# Altium project HMI-MPG.PrjPcb
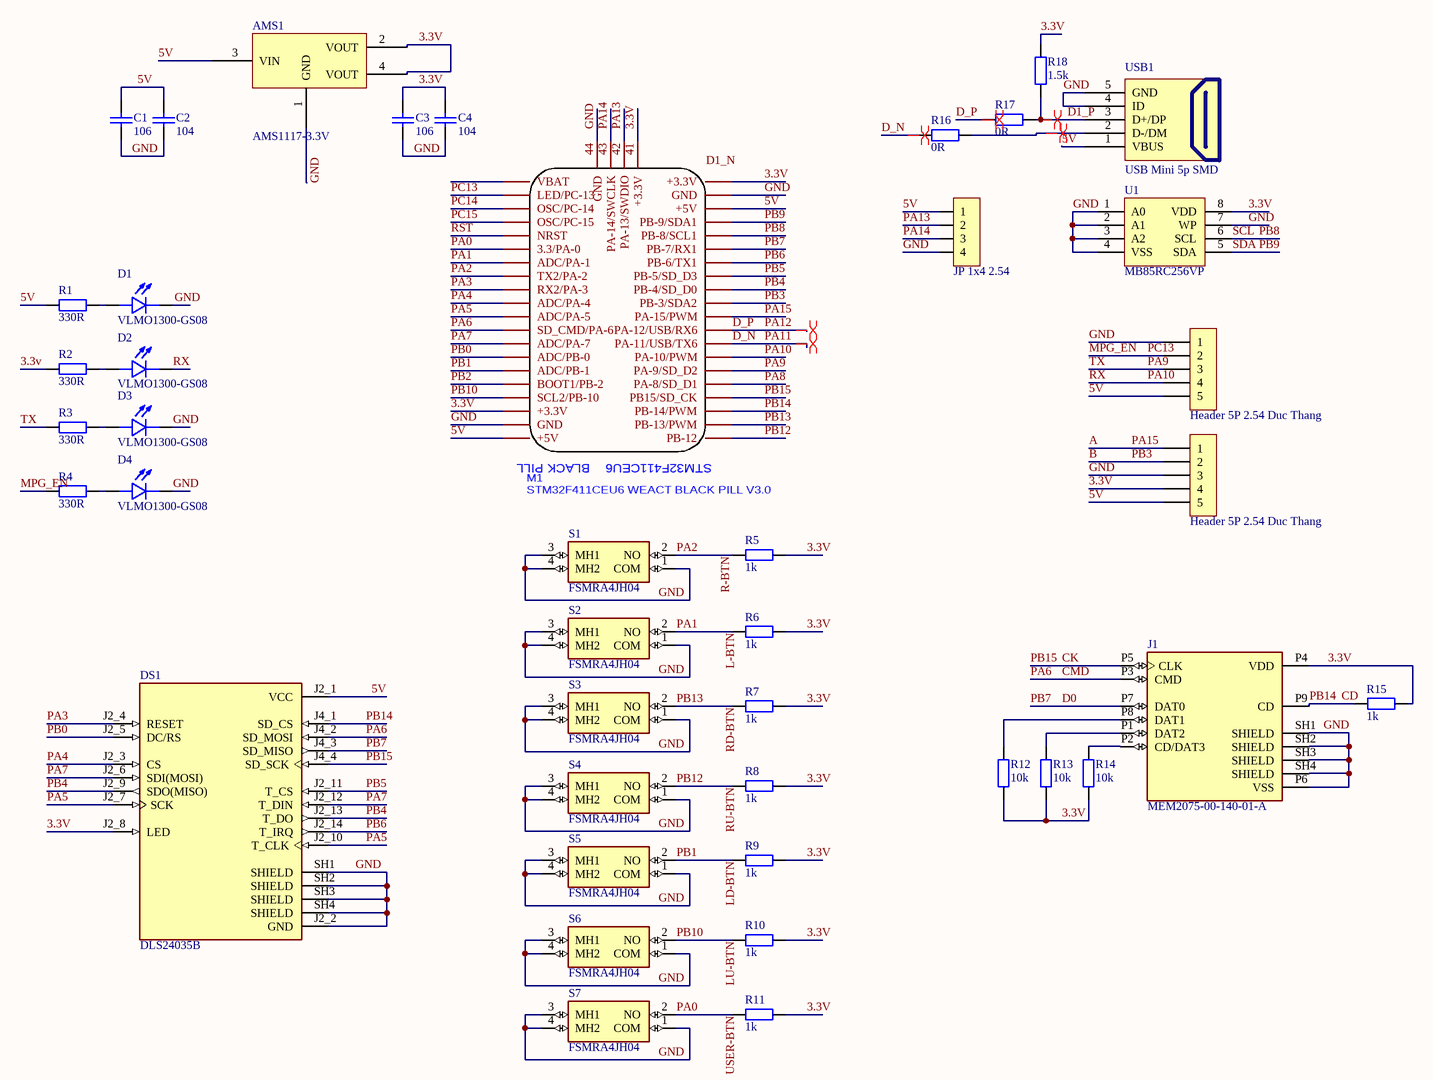
[diagram p0: Schematic.SchDoc]
1 sheet, 42 parts. Net scope: global (net labels, ports and power ports of the same name join across sheets).
Board file: PCB.PcbDoc

## Sheet Schematic.SchDoc
size A3; SheetNumber: 1; SheetTotal: 1

### Parts
AMS1  AMS1117-3.3V  [SOT223]
C1  106  [tu 0603]
C2  104  [tu 0603]
C3  106  [tu 0603]
C4  104  [tu 0603]
D1  VLMO1300-GS08  [LED_VLMO1300-GS08]
D2  VLMO1300-GS08  [LED_VLMO1300-GS08]
D3  VLMO1300-GS08  [LED_VLMO1300-GS08]
D4  VLMO1300-GS08  [LED_VLMO1300-GS08]
DS1  DLS24035B  [LCD_DLS24035B]
H1  Header 5P 2.54 Duc Thang  [XH2.54M-5]
H2  Header 5P 2.54 Duc Thang  [XH2.54M-5]
J1  MEM2075-00-140-01-A  [GCT_MEM2075-00-140-01-A]
JP1  JP 1x4 2.54  [JP 1x4 DT]
M1  STM32F411CEU6 WEACT BLACK PILL V3.0  [STM32F411CEU6BP]
R1  330R  [tro smd 0603]
R2  330R  [tro smd 0603]
R3  330R  [tro smd 0603]
R4  330R  [tro smd 0603]
R5  1k  [tro smd 0603]
R6  1k  [tro smd 0603]
R7  1k  [tro smd 0603]
R8  1k  [tro smd 0603]
R9  1k  [tro smd 0603]
R10  1k  [tro smd 0603]
R11  1k  [tro smd 0603]
R12  10k  [tro smd 0603]
R13  10k  [tro smd 0603]
R14  10k  [tro smd 0603]
R15  1k  [tro smd 0603]
R16  0R  [tro smd 0603]
R17  0R  [tro smd 0603]
R18  1.5k  [tro smd 0603]
S1  FSMRA4JH04  [FSMRA4JH04]
S2  FSMRA4JH04  [FSMRA4JH04]
S3  FSMRA4JH04  [FSMRA4JH04]
S4  FSMRA4JH04  [FSMRA4JH04]
S5  FSMRA4JH04  [FSMRA4JH04]
S6  FSMRA4JH04  [FSMRA4JH04]
S7  FSMRA4JH04  [FSMRA4JH04]
U1  MB85RC256VP  [SOIC8_50_328_25X90_SMT]
USB1  USB Mini 5p SMD  [USB Mini 5p SMD]

### Nets
3.3V: AMS1.2(VOUT) AMS1.4(VOUT) C3.1 C4.1 DS1.J2_8(LED) H2.4 J1.P4(VDD) M1.20(+3.3V) M1.38(+3.3V) M1.41(+3.3V) R2.1 R5.2 R6.2 R7.2 R8.2 R9.2 R10.2 R11.2 R12.1 R13.1 R14.1 R15.2 R18.2 U1.8(VDD)
5V: AMS1.3(VIN) C1.1 C2.1 DS1.J2_1(VCC) H1.5 H2.5 JP1.1 M1.18(+5V) M1.40(+5V) R1.1 USB1.1(VBUS)
A: H2.1 M1.10(PA-15/PWM)  [also labelled PA15]
B: H2.2 M1.11(PB-3/SDA2)  [also labelled PB3]
CD: DS1.J4_1(SD_CS) J1.P9(CD) M1.3(PB-14/PWM) R15.1  [also labelled PB14]
CK: DS1.J4_4(SD_SCK) J1.P5(CLK) M1.4(PB15/SD_CK)  [also labelled PB15]
CMD: DS1.J4_2(SD_MOSI) J1.P3(CMD) M1.32(SD_CMD/PA-6)  [also labelled PA6]
D0: DS1.J4_3(SD_MISO) J1.P7(DAT0) M1.15(PB-7/RX1)  [also labelled PB7]
D1_P: R17.2 R18.1 USB1.3(D+/DP)
D_N: M1.8(PA-11/USB/TX6) R16.1  [also labelled PA11]
D_P: M1.9(PA-12/USB/RX6) R17.1  [also labelled PA12]
GND: AMS1.1(GND) C1.2 C2.2 C3.2 C4.2 D1.C D3.C D4.C DS1.J2_2(GND) DS1.SH1(SHIELD) DS1.SH2(SHIELD) DS1.SH3(SHIELD) DS1.SH4(SHIELD) H1.1 H2.3 J1.P6(VSS) J1.SH1(SHIELD) J1.SH2(SHIELD) J1.SH3(SHIELD) J1.SH4(SHIELD) JP1.4 M1.19(GND) M1.39(GND) M1.44(GND) S1.1(COM) S1.3(MH1) S1.4(MH2) S2.1(COM) S2.3(MH1) S2.4(MH2) S3.1(COM) S3.3(MH1) S3.4(MH2) S4.1(COM) S4.3(MH1) S4.4(MH2) S5.1(COM) S5.3(MH1) S5.4(MH2) S6.1(COM) S6.3(MH1) S6.4(MH2) S7.1(COM) S7.3(MH1) S7.4(MH2) U1.1(A0) U1.2(A1) U1.3(A2) U1.4(VSS) U1.7(WP) USB1.4(ID) USB1.5(GND)
L-BTN: M1.27(ADC/PA-1) R6.1 S2.2(NO)  [also labelled PA1]
LD-BTN: M1.35(ADC/PB-1) R9.1 S5.2(NO)  [also labelled PB1]
LU-BTN: M1.37(SCL2/PB-10) R10.1 S6.2(NO)  [also labelled PB10]
MPG_EN: H1.2 M1.22(LED/PC-13) R4.1  [also labelled PC13]
PA0: M1.26(3.3/PA-0) R11.1 S7.2(NO)  [also labelled USER-BTN]
PA2: M1.28(TX2/PA-2) R5.1 S1.2(NO)  [also labelled R-BTN]
PA3: DS1.J2_4(RESET) M1.29(RX2/PA-3)
PA4: DS1.J2_3(CS) M1.30(ADC/PA-4)
PA5: DS1.J2_7(SCK) DS1.J2_10(T_CLK) M1.31(ADC/PA-5)
PA7: DS1.J2_6(SDI(MOSI)) DS1.J2_12(T_DIN) M1.33(ADC/PA-7)
PA8: M1.5(PA-8/SD_D1)
PA9: H1.3 M1.6(PA-9/SD_D2) R3.1  [also labelled TX]
PA10: D2.C H1.4 M1.7(PA-10/PWM)  [also labelled RX]
PA13: JP1.2 M1.42(PA-13/SWDIO)
PA14: JP1.3 M1.43(PA-14/SWCLK)
PB0: DS1.J2_5(DC/RS) M1.34(ADC/PB-0)
PB2: M1.36(BOOT1/PB-2)
PB4: DS1.J2_9(SDO(MISO)) DS1.J2_13(T_DO) M1.12(PB-4/SD_D0)
PB5: DS1.J2_11(T_CS) M1.13(PB-5/SD_D3)
PB6: DS1.J2_14(T_IRQ) M1.14(PB-6/TX1)
PB8: M1.16(PB-8/SCL1) U1.6(SCL)  [also labelled SCL]
PB9: M1.17(PB-9/SDA1) U1.5(SDA)  [also labelled SDA]
PB12: M1.1(PB-12) R8.1 S4.2(NO)  [also labelled RU-BTN]
PB13: M1.2(PB-13/PWM) R7.1 S3.2(NO)  [also labelled RD-BTN]
PC14: M1.23(OSC/PC-14)
PC15: M1.24(OSC/PC-15)
RST: M1.25(NRST)
NetD1_A: D1.A R1.2
NetD2_A: D2.A R2.2
NetD3_A: D3.A R3.2
NetD4_A: D4.A R4.2
NetJ1_P1: J1.P1(DAT2) R13.2
NetJ1_P2: J1.P2(CD/DAT3) R14.2
NetJ1_P8: J1.P8(DAT1) R12.2
NetR16_2: R16.2 USB1.2(D-/DM)

Not connected (* = marked no-connect by the designer): M1 21(VBAT)

### Layout directives
differential pair: D1_P, D_N, D_P, NetR16_2

### Notes on the sheet
- Labels drawn without touching a wire or pin: D1_N
- (in symbol STM32F411CEU6 WEACT BLACK PILL V3.0) BLACK PILL; STM32F411CEU6

### Library data of the parts
AMS1 = AMS1117 SMD: Dán; Value: AMS1117-3.3V SOT223; Don_Vi: Con; Ma_Hang: MH000596; Ghi_Chu: *; Kieu_Chan: *; Chung_Loai: Dán
C1 C3 = Tu 0603 106 16V 20%: Dán; Don_Vi: Con; So_Chan: 2; Ten_Linh_Kien: Tụ 0603-10uF 20% 16V; Ma_Hang: MH004848; Chung_Loai: Dán; Kieu_Chan: *
C2 C4 = Tu 0603 104 50V 10%: Dán; Don_Vi: Con; So_Chan: 2; Ten_Linh_Kien: Tụ 0603 104-100nF 10% 50V; Ma_Hang: MH004568; Chung_Loai: Dán; Kieu_Chan: *
D1-D4 = VLMO1300-GS08: Orange 605nm LED Indication - Discrete 2V 0603 (1608 Metric); MF: Vishay; SnapEDA_Link: https://www.snapeda.com/parts/VLMO1300-GS08/Vishay+Semiconductor+Opto+Division/view-part/?ref=snap; Package: 0603 Vishay; Value: *; MP: VLMO1300-GS08; Check_prices: https://www.snapeda.com/parts/VLMO1300-GS08/Vishay+Semiconductor+Opto+Division/view-part/?ref=eda
DS1 = DLS24035B: 3.5 Inch 480*320 SPI TFT LCD Module with ILI9488 Driver; MF: Elecrow; SnapEDA_Link: https://www.snapeda.com/parts/DLS24035B/Elecrow/view-part/?ref=snap; Package: None; Value: *; MP: DLS24035B; Check_prices: https://www.snapeda.com/parts/DLS24035B/Elecrow/view-part/?ref=eda
H1 H2 = Header 5P 2.54 Duc Thang: Cắm; Ten_Linh_Kien: Header 5P XH2.54-5P Đực Thẳng; Don_Vi: Con; Ma_Hang: MH001298; Chung_Loai: Cắm
J1 = MEM2075-00-140-01-A: 9 (8 + 1) Position Card Connector microSD Surface Mount, Right Angle Gold; MF: Global Connector Technology; SnapEDA_Link: https://www.snapeda.com/parts/MEM2075-00-140-01-A/Global+Connector+Technology/view-part/?ref=snap; Package: None; Value: *; MP: MEM2075-00-140-01-A; Check_prices: https://www.snapeda.com/parts/MEM2075-00-140-01-A/Global+Connector+Technology/view-part/?ref=eda
JP1 = JP 1x4 2.54 Duc Thang: Cắm; Ten_Linh_Kien: Jump Đơn Đực 2.54MM 1x40P Thẳng 11MM; Don_Vi: Con; Ma_Hang: MH000903; Ghi_Chu: *; Kieu_Chan: *; Chung_Loai: Cắm
R1-R4 = Tro 0603 5% 330R: Dán; Don_Vi: Con; Ma_Hang: MH006910; So_Chan: 2; Ten_Linh_Kien: Trở 0603 5% 330R; Chung_Loai: Dán; Kieu_Chan: *
R5-R11 R15 = Tro 0603 1% 1k: Dán; So_Chan: 2; Don_Vi: Con; Ten_Linh_Kien: Trở 0603 1% 1k; Ma_Hang: MH006334; Chung_Loai: Dán; Kieu_Chan: *
R12-R14 = Tro 0603 1% 10k: Dán; Don_Vi: Con; So_Chan: 2; Ten_Linh_Kien: Trở 0603 1% 10k; Ma_Hang: MH006333; Chung_Loai: Dán; Kieu_Chan: *
R16 R17 = Tro 0603 1% 0R: Dán; Don_Vi: Con; So_Chan: 2; Ten_Linh_Kien: Trở 0603 1% 0R; Ma_Hang: MH005792; Chung_Loai: Dán; Kieu_Chan: *
R18 = Tro 0603 5% 1.5k: Dán; Don_Vi: Con; So_Chan: 2; Ten_Linh_Kien: Trở 0603 5% 1.5k; Ma_Hang: MH006313; Chung_Loai: Dán; Kieu_Chan: *
S1-S7 = FSMRA4JH04: Switch,Pushbutton, Tactile, Single Pole, 50mA,Right Angle | TE Connectivity FSMRA4JH04; SnapEDA_Link: https://www.snapeda.com/parts/FSMRA4JH04/TE+Connectivity/view-part/?ref=snap; Package: None; Value: *; MF: TE Connectivity; MP: FSMRA4JH04; Check_prices: https://www.snapeda.com/parts/FSMRA4JH04/TE+Connectivity/view-part/?ref=eda
U1 = IC_MB85RC256VPF-G-JNERE2: FRAM (Ferroelectric RAM) Memory IC 256Kb (32K x 8) I²C 1MHz 550ns 8-SOP; Manufacturer: Fujitsu; Alternate Part Number-1: NA; Manufacturer Part Number: MB85RC256VPF-G-JNERE2; Case/Package: SOIC8; Supplier-1: LCSC; Supplier Part Number-1: C126728
USB1 = USB Mini 5p SMD: USB Type B; Ten: MiniUSB 5P SMD; Ma_Hang: MH001022